# Altium schematic sheet DISPLAY.SchDoc
size A4; SheetNumber: 7; SheetTotal: 11
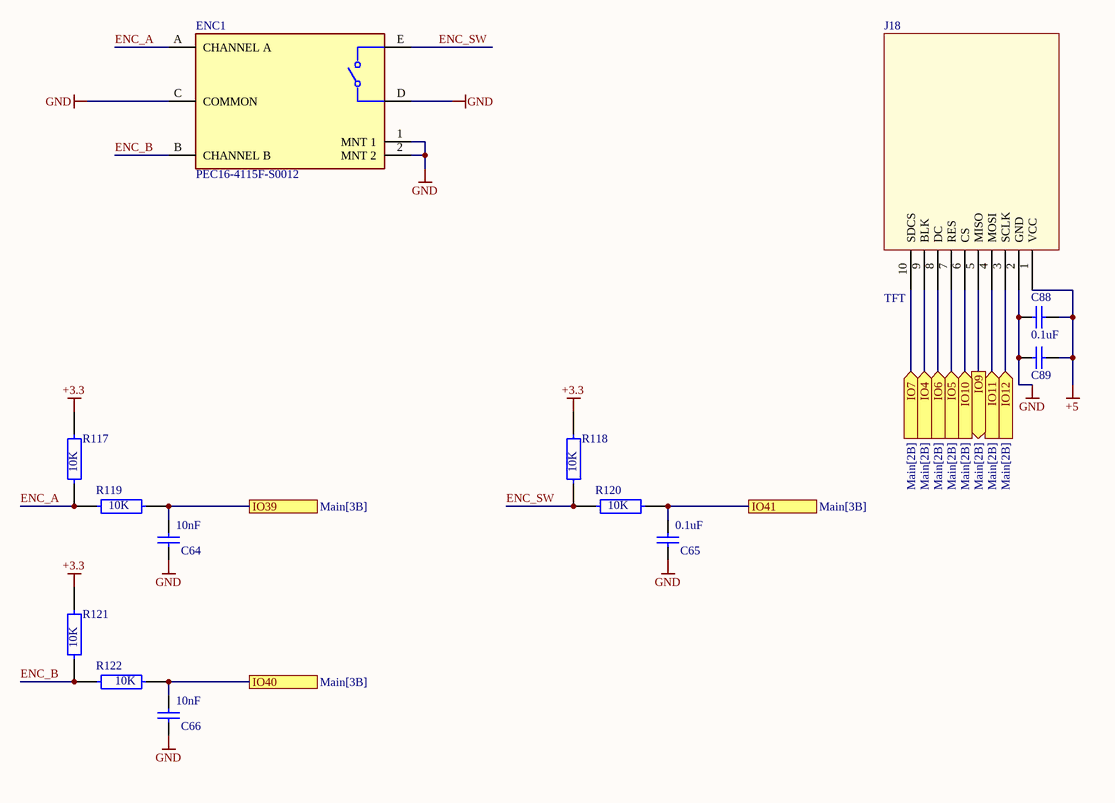
[diagram p0: DISPLAY.SchDoc]

## Parts
C64  10nF  [CAPC2013X145X48NL20T23]
C65  0.1uF  [CAPC2013X145X48NL20T23]
C66  10nF  [CAPC2013X145X48NL20T23]
C88  0.1uF  [CAPC2013X145X48NL20T23]
C89  10uF  [CAPC2013X145X48NL20T23]  (value not drawn)
ENC1  PEC16-4115F-S0012  [FP-PEC16-4115F-S0012-MFG]
J18  TFT  [DFR0664_TFT_1x10_P2.54_M2]
R117  10K  [FP-RN73R2A-IPC_A]
R118  10K  [FP-RN73R2A-IPC_A]
R119  10K  [FP-RN73R2A-IPC_A]
R120  10K  [FP-RN73R2A-IPC_A]
R121  10K  [FP-RN73R2A-IPC_A]
R122  10K  [FP-RN73R2A-IPC_A]

## Ports
IO4 (in, see Main[2B]), IO5 (in, see Main[2B]), IO6 (in, see Main[2B]), IO7 (in, see Main[2B]), IO9 (out, see Main[2B]), IO10 (in, see Main[2B]), IO11 (in, see Main[2B]), IO12 (in, see Main[2B]), IO39 (see Main[3B]), IO40 (see Main[3B]), IO41 (see Main[3B])

## Nets
+3.3: R117.2 R118.2 R121.2
+5: C88.2 C89.2 J18.1(VCC)
GND: C64.1 C65.1 C66.1 C88.1 C89.1 ENC1.1(MNT_1) ENC1.2(MNT_2) ENC1.C(COMMON) ENC1.D J18.2(GND)
ENC_A: ENC1.A(CHANNEL_A) R117.1 R119.2
ENC_B: ENC1.B(CHANNEL_B) R121.1 R122.2
ENC_SW: ENC1.E R118.1 R120.2
IO4: J18.9(BLK) ; port IO4
IO5: J18.7(RES) ; port IO5
IO6: J18.8(DC) ; port IO6
IO7: J18.10(SDCS) ; port IO7
IO9: J18.5(MISO) ; port IO9
IO10: J18.6(CS) ; port IO10
IO11: J18.4(MOSI) ; port IO11
IO12: J18.3(SCLK) ; port IO12
IO39: C64.2 R119.1 ; port IO39
IO40: C66.2 R122.1 ; port IO40
IO41: C65.2 R120.1 ; port IO41

## Library data of the parts
C64-C66 C88 C89 = CAP: Manufacturer: Vitramon; Part Number: VJ0805Y682KXAMT
ENC1 = ROTARY: ROTARY ENCODER MECHANICAL 12PPR; Pulses per Revolution: 12; Built in Switch: Yes; Output Type: Quadrature; Number of Channels: 2; Operating Supply Voltage: 5V; Min Operating Temperature: -30°C; Package Quantity: 50; Length: 23mm; Height: 17.3mm; Mount: Through Hole; Termination: PC Pin; Encoder Type: Mechanical; Max Operating Temperature: 70°C; Orientation: Vertical; RoHS Compliant: Yes; Series: PEC16; Width: 16mm; Detent: Yes
J18 = DFR0664
R117-R122 = Resistor: RES 10K OHM 0.1% 1/8W 0805